# EAGLE design SMPS-DIN (EAGLE 9.6.2)
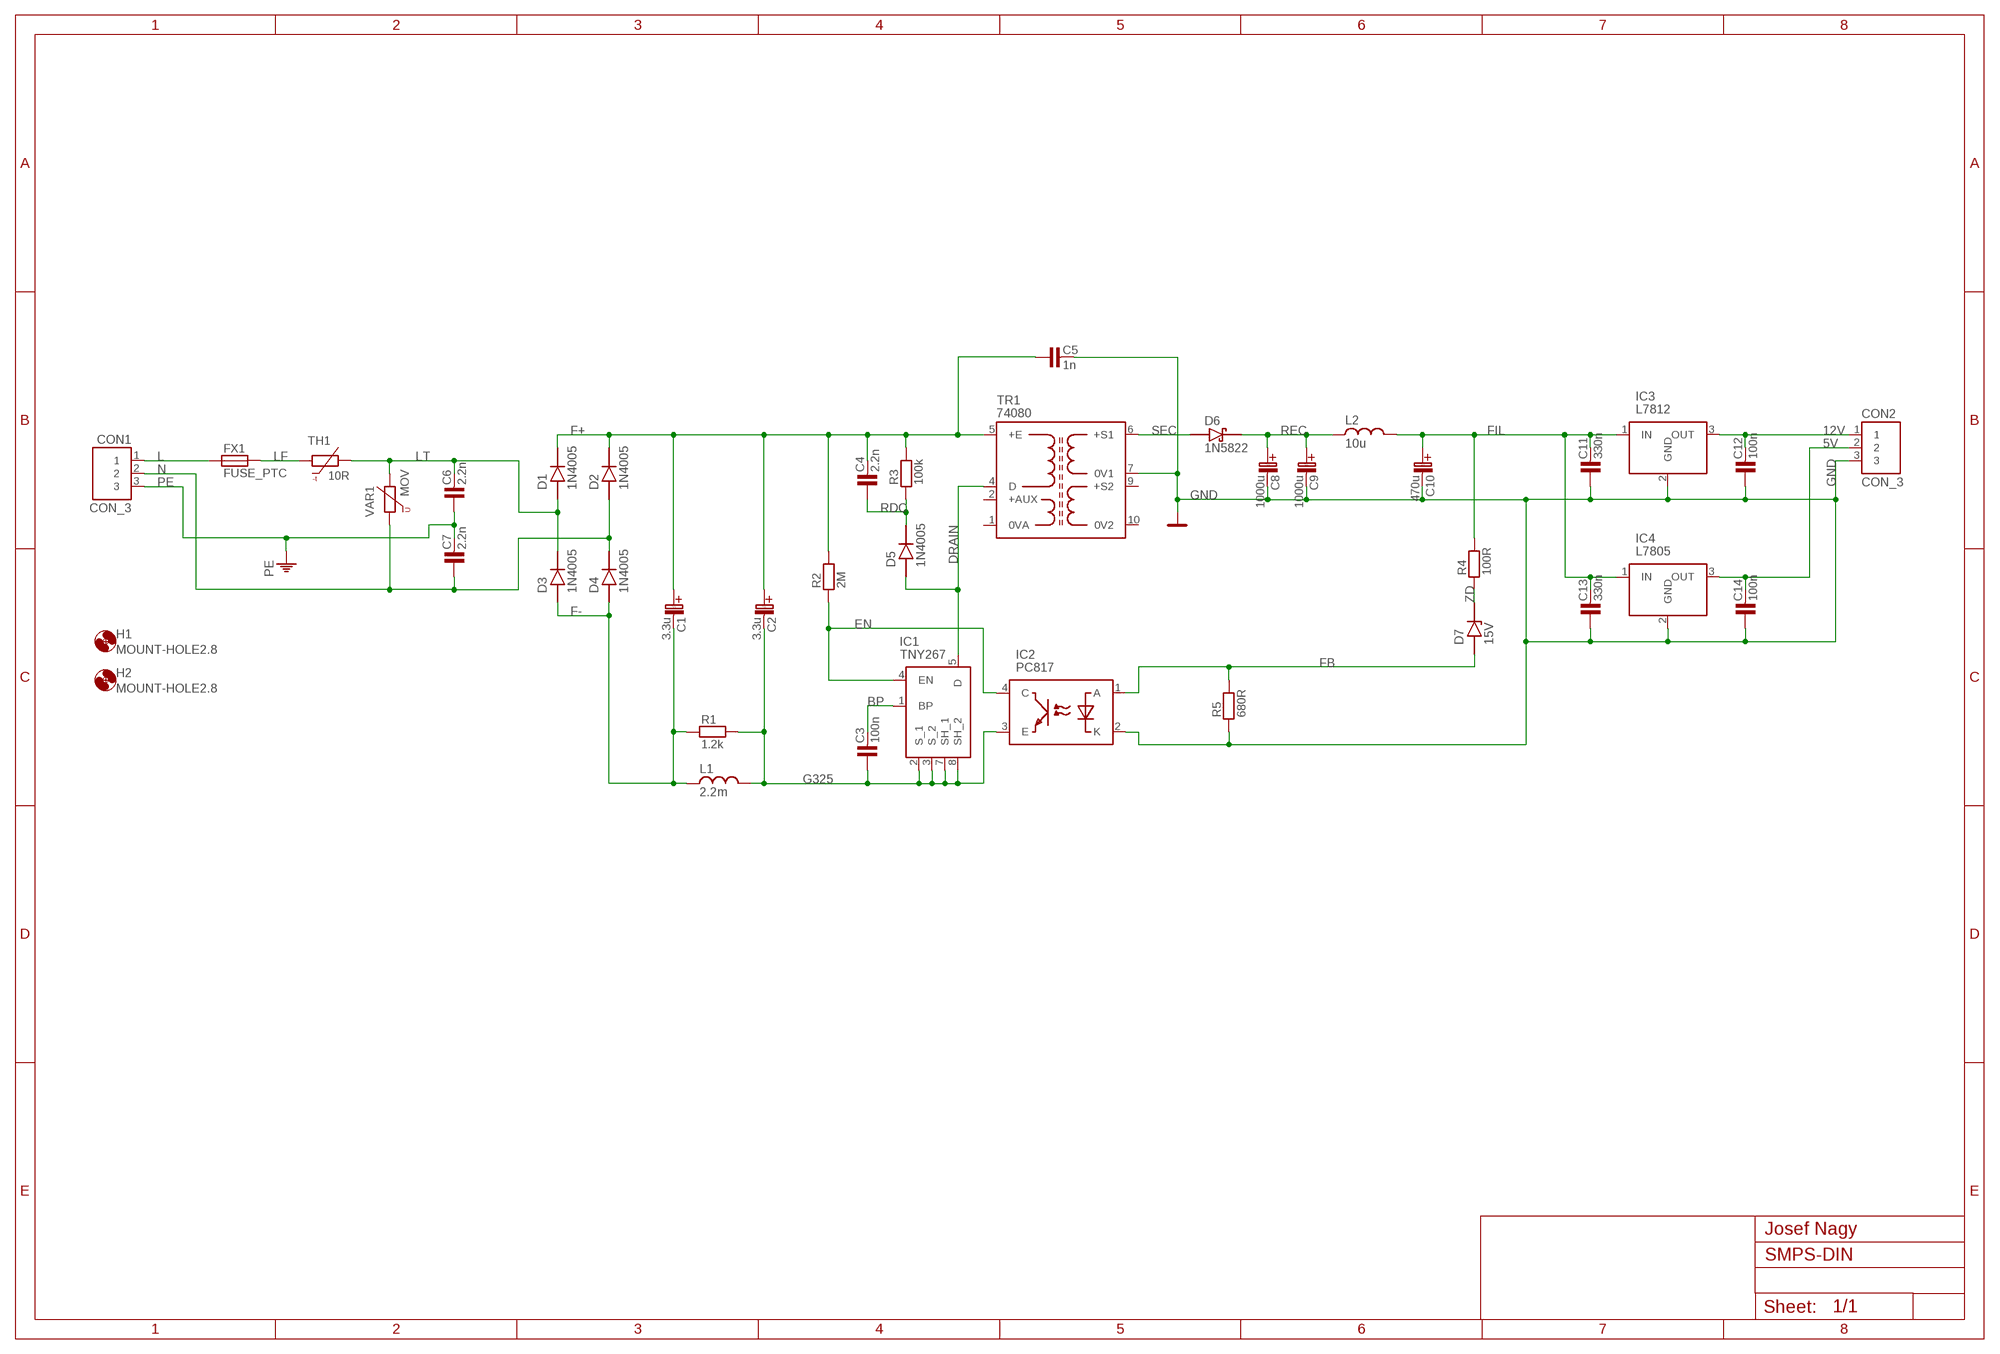
[diagram p0: schematic, sheet 1]

## Parts
C1  3.3u  C-EL_5  [C-EL_5]
C2  3.3u  C-EL_5  [C-EL_5]
C3  100n  C_KER_10  [C-10]
C4  2.2n  C_KER_10  [C-10]
C5  1n  C_KER_10  [C-10]
C6  2.2n  C_KER_10  [C-10]
C7  2.2n  C_KER_10  [C-10]
C8  1000u  C-EL_5  [C-EL_5]
C9  1000u  C-EL_5  [C-EL_5]
C10  470u  C-EL_5  [C-EL_5]
C11  330n  C_KER_5  [C-5]
C12  100n  C_KER_2,5  [C-2,5]
C13  330n  C_KER_5  [C-5]
C14  100n  C_KER_2,5  [C-2,5]
CON1  CON_3  [CON3]
CON2  CON_3  [CON3]
D1  1N4005  D_DO41V  [DO41_V]
D2  1N4005  D_DO41V  [DO41_V]
D3  1N4005  D_DO41V  [DO41_V]
D4  1N4005  D_DO41V  [DO41_V]
D5  1N4005  D_DO41V  [DO41_V]
D6  1N5822  D-SCHOTTKY_DO201V  [DO201_V]
D7  15V  D-ZENER_DO35  [DO35]
FX1  FUSE_PTC  [FUSE_PTC]
H1  MOUNT-HOLE2.8  [2,8]
H2  MOUNT-HOLE2.8  [2,8]
IC1  TNY267  TNY267PN  [P-PACKAGE(DIP-8B)_1]
IC2  PC817  PC817X4NSZ1B  [DIP762W60P254L460H455Q4N]
IC3  L7812  L78XX  [TO255P460X1020X2008-3P]
IC4  L7805  L78XX  [TO255P460X1020X2008-3P]
L1  2.2m  L_5  [L-5]
L2  10u  L_3  [L-3]
R1  1.2k  R_7,5  [R-7,5]
R2  2M  R_STOJ2  [R-STOJ2]
R3  100k  R_7,5  [R-7,5]
R4  100R  R_7,5  [R-7,5]
R5  680R  R_7,5  [R-7,5]
TH1  10R  THERMISTOR_1  [THERMISTOR]
TR1  74080  [74080]
VAR1  MOV  VARISTOR_1  [MOV_VARISTOR]

## Nets
5V: C14.2 CON2.2 IC4.3(OUT)
12V: C12.2 CON2.1 IC3.3(OUT)
BP: C3.2 IC1.1(BP)
DRAIN: D5.A IC1.5(D) TR1.4(D)
EN: IC1.4(EN) IC2.4(C) R2.1
F+: C1.C+(C_EL+) C2.C+(C_EL+) C4.2 C5.1 D1.K(C) D2.K(C) R2.2 R3.2 TR1.5(+E)
F-: C1.C-(C_EL-) D3.A D4.A L1.1 R1.1
FB: D7.A IC2.1(A) R5.2
FIL: C10.C+(C_EL+) C11.2 C13.2 IC3.1(IN) IC4.1(IN) L2.2 R4.2
G325: C2.C-(C_EL-) C3.1 IC1.2(S_1) IC1.3(S_2) IC1.7(SH_1) IC1.8(SH_2) IC2.3(E) L1.2 R1.2
GND: C5.2 C8.C-(C_EL-) C9.C-(C_EL-) C10.C-(C_EL-) C11.1 C12.1 C13.1 C14.1 CON2.3 IC2.2(K) IC3.2(GND) IC4.2(GND) R5.1 TR1.7(0V1)
L: CON1.1 FX1.1
LF: FX1.2 TH1.1
LT: C6.2 D1.A D3.K(C) TH1.2 VAR1.2
N: C7.1 CON1.2 D2.A D4.K(C) VAR1.1
PE: C6.1 C7.2 CON1.3
RDC: C4.1 D5.K(C) R3.1
REC: C8.C+(C_EL+) C9.C+(C_EL+) D6.K(C) L2.1
SEC: D6.A TR1.6(+S1)
ZD: D7.K(C) R4.1
Unconnected: TR1.1(0VA) TR1.2(+AUX) TR1.9(+S2) TR1.10(0V2)

## Notes on the sheet
- Josef Nagy

## Library data of the parts
C1 C2 C8-C10 = #_NG_knihovna:C-EL: Kondenzator - elektrolyticky
C3-C7 C11-C14 = #_NG_knihovna:C_KER: Kondenzator - keramicky
CON1 CON2 = #_NG_knihovna:CON_3
D1-D5 = #_NG_knihovna:D
D6 = #_NG_knihovna:D-SCHOTTKY; SPICEPREFIX: D
D7 = #_NG_knihovna:D-ZENER
FX1 = #_NG_knihovna:FUSE
H1 H2 = #_NG_knihovna:MOUNT-HOLE: MOUNTING HOLE with drill center marker
IC1 = #_NG_knihovna:TNY267PN: AC/DC Converters 12W 85-265 VAC 19W/230 VAC Source: Datasheet <https://componentsearchengine.com/Datasheets/1/TNY267PN.pdf>; DESCRIPTION: AC/DC Converters 12W 85-265 VAC 19W/230 VAC; HEIGHT: mm; MANUFACTURER_NAME: Power Integrations; MANUFACTURER_PART_NUMBER: TNY267PN
IC2 = #_NG_knihovna:PC817X4NSZ1B: Transistor Output Optocouplers OPTOISOLATOR 5KV TRANS DIP, Optoisolator Transistor Output 1 Channel Source: Datasheet <https://componentsearchengine.com/Datasheets/1/PC817X4NSZ1B.pdf>; DESCRIPTION: Transistor Output Optocouplers OPTOISOLATOR 5KV TRANS DIP, Optoisolator Transistor Output 1 Channel; HEIGHT: 4.55mm; MANUFACTURER_NAME: Sharp Microelectronics; MANUFACTURER_PART_NUMBER: PC817X4NSZ1B
IC3 IC4 = #_NG_knihovna:L78XX
L1 L2 = #_NG_knihovna:L
R1-R5 = #_NG_knihovna:R: Rezistor
TH1 = #_NG_knihovna:THERMISTOR
TR1 = #_NG_knihovna:74080: Transformer: impulse; 185VAC,265VAC; 915V; 915V; 1.5A; 1.5A; PCB Source: Datasheet <https://www.tme.com/Document/74b1c6fdfa5c80edd28be424718b4d1b/74080.pdf>; DESCRIPTION: Transformer: impulse; 185VAC,265VAC; 915V; 915V; 1.5A; 1.5A; PCB; HEIGHT: 18mm; MANUFACTURER_NAME: MYRRA; MANUFACTURER_PART_NUMBER: 74080
VAR1 = #_NG_knihovna:VARISTOR

## Board
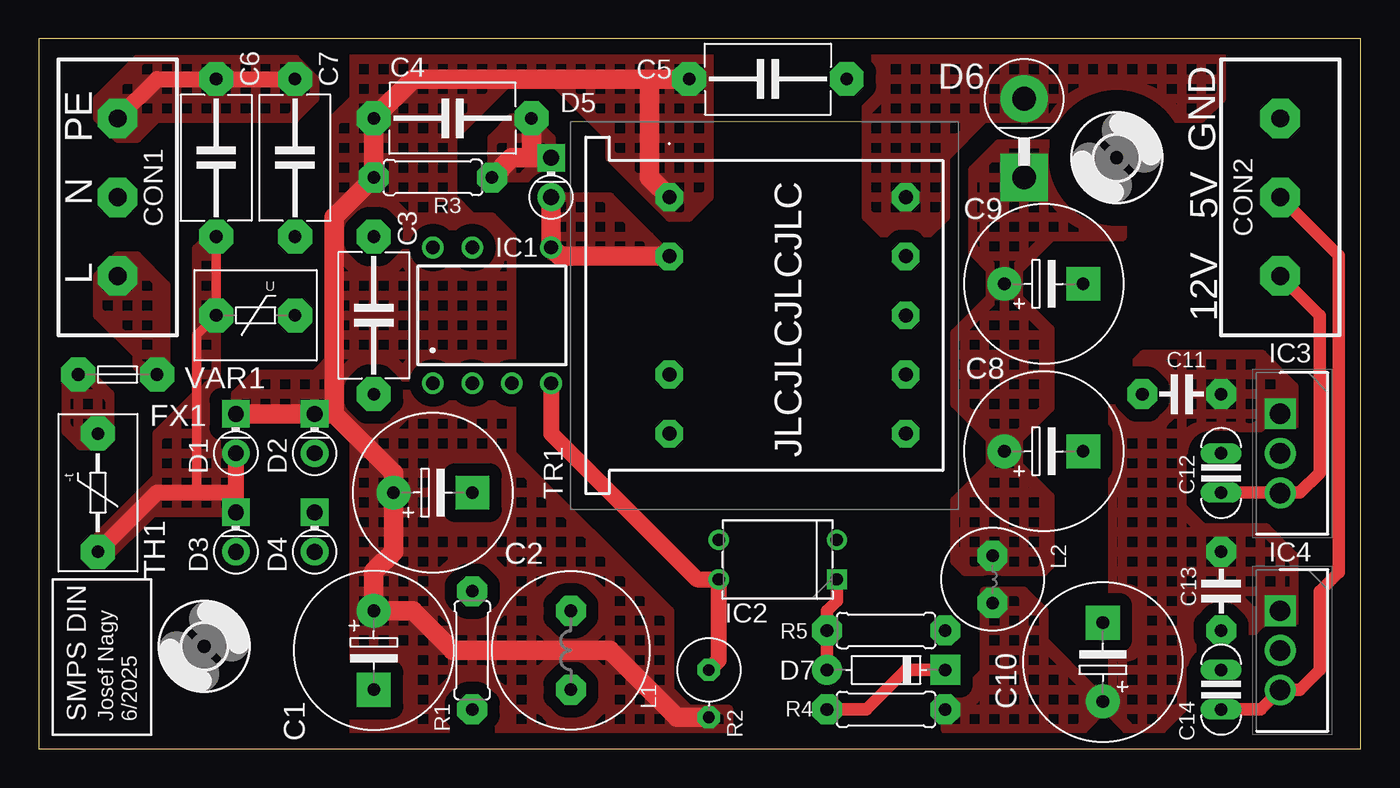
[diagram p1: board, top side]
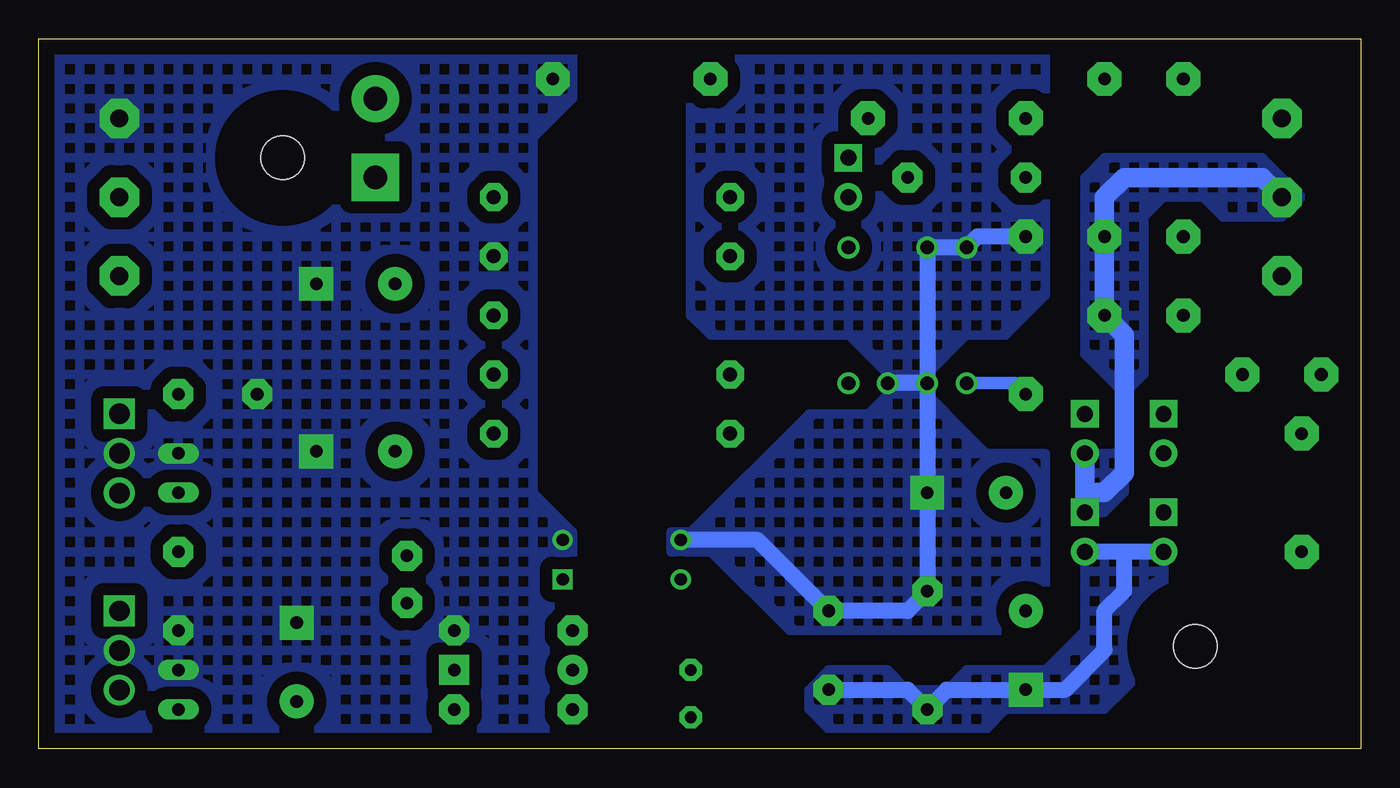
[diagram p2: board, bottom side, seen from below]

Size 85.2 x 45.77 mm. Coordinates in mm from the lower left corner, seen from the top.
Outline: 0,0 85.2,0 85.2,45.77 0,45.77 0,0
Copper layers (1*16): Top 0.035mm / dielectric 1.5mm / Bottom 0.035mm
Design rules "default": minimum track width 6mil, minimum drill 0.35mm, track to track 6mil, track to pad 6mil, pad to pad 6mil, via to via 6mil, smd to smd 6mil, copper to edge 40mil, drill to drill 6mil, minimum pad ring 10mil, minimum via ring 8mil, stop-mask expansion 4mil, vias tented up to drill 0mil, thermal gap 10mil

### Footprints (pad centres in the part's own frame; a part is rotated, then mirrored left to right if it is on the bottom)
C-EL_5 = drill 0.813 pad 2.184: C+ -2.54,0 | drill 0.813 pad 2.184 square: C- 2.54,0
C-10 = drill 0.813 pad 2.184 octagon: 1 -5.08,0; 2 5.08,0
C-5 = drill 0.813 pad 1.93 octagon: 1 -2.54,0; 2 2.54,0
C-2,5 = drill 0.813 pad 1.27 long: 1 -1.27,0; 2 1.27,0
CON3 = drill 1.143 pad 2.54 octagon: 1 -5.08,0; 2 0,0; 3 5.08,0
DO41_V = drill 1.016 pad 1.778: A -1.27,0 | drill 1.016 pad 1.778 square: K 1.27,0
DO201_V = drill 1.524 pad 3.048: A -2.54,0 | drill 1.524 pad 3.048 square: K 2.54,0
DO35 = drill 0.813 pad 1.93: A -3.81,0 | drill 0.813 pad 1.93 square: K 3.81,0
FUSE_PTC = drill 0.813 pad 2.184 octagon: 1 -2.54,0; 2 2.54,0
2,8 = hole 2.8: 0,0
P-PACKAGE(DIP-8B)_1 = drill 0.88 pad 1.4: 1 -3.81,-4.375; 2 -1.27,-4.375; 3 1.27,-4.375; 4 3.81,-4.375; 5 3.81,4.375; 7 -1.27,4.375; 8 -3.81,4.375
DIP762W60P254L460H455Q4N = drill 0.8 pad 1.27 square: 1 -3.81,1.27 | drill 0.8 pad 1.27: 2 -3.81,-1.27; 3 3.81,-1.27; 4 3.81,1.27
TO255P460X1020X2008-3P = drill 1.32 pad 1.98 square: 1 0,0 | drill 1.32 pad 1.98: 2 2.55,0; 3 5.1,0
L-5 = drill 0.813 pad 1.93 octagon: 1 -2.54,0; 2 2.54,0
L-3 = drill 0.813 pad 1.93 octagon: 1 -1.524,0; 2 1.524,0
R-7,5 = drill 0.813 pad 1.93 octagon: 1 -3.81,0; 2 3.81,0
R-STOJ2 = drill 0.75 pad 1.422 octagon: 1 -1.27,0; 2 1.778,0
THERMISTOR = drill 0.813 pad 2.184 octagon: 1 -3.81,0; 2 3.81,0
74080 = drill 0.9 pad 1.778 octagon: 1 0,-15.24; 2 0,-11.43; 4 0,-3.81; 5 0,0; 6 15.24,0; 7 15.24,-3.81; 8 15.24,-7.62; 9 15.24,-11.43; 10 15.24,-15.24
MOV_VARISTOR = drill 0.813 pad 2.184 octagon: 1 -2.54,0; 2 2.54,0

### Placement (x,y rotation side)
C1  21.59,6.35 270 top
C2  25.4,16.51 0 top
C3  21.59,27.94 270 top
C4  26.67,40.64 180 top
C5  46.99,43.18 0 top
C6  11.43,38.1 270 top
C7  16.51,38.1 90 top
C8  64.77,19.18 0 top
C9  64.77,29.97 0 top
C10  68.58,5.59 90 top
C11  73.66,22.86 0 top
C12  76.2,17.78 270 top
C13  76.2,10.16 90 top
C14  76.2,3.81 270 top
CON1  5.08,35.56 90 top
CON2  80.01,35.56 90 top
D1  12.7,20.32 90 top
D2  17.78,20.32 90 top
D3  12.7,13.97 90 top
D4  17.78,13.97 90 top
D5  33.02,36.83 90 top
D6  63.5,39.37 270 top
D7  54.61,5.08 0 top
FX1  5.08,24.13 180 top
H1  10.67,6.6 0 top
H2  69.47,38.1 0 top
IC1  29.21,27.94 0 top
IC2  47.62,12.19 180 top
IC3  80.01,21.59 270 top
IC4  80.01,8.89 270 top
L1  34.29,6.35 90 top
L2  61.47,10.92 270 top
R1  27.94,6.35 90 top
R2  43.18,3.81 270 top
R3  25.4,36.83 180 top
R4  54.61,2.54 0 top
R5  54.61,7.62 180 top
TH1  3.81,16.51 270 top
TR1  40.64,35.56 0 top
VAR1  13.97,27.94 180 top

### Tracks (layer width: path | path; a pad name or v marks a point on that pad's centre or on a via)
5V
  Top 0.813: C14.2 78.76,2.54 IC4.3 81.26,3.79 82.55,5.08 82.55,10.16 83.78,11.38 83.78,31.8 CON2.2
12V
  Top 0.813: C12.2 79.99,16.51 | 79.99,16.51 IC3.3 | CON2.1 82.55,27.94 82.55,17.78 81.28,16.51 79.99,16.51
BP
  Bottom 0.813: IC1.1 22.3,23.57 C3.2
DRAIN
  Top 1.27: D5.A IC1.5 33.59,31.75 TR1.4
  pour Top (isolate 0.813, no thermals, hatched): 33.02,35.56 33.02,31.75 40.64,31.75 39.37,33.02 36.83,35.56
EN
  Top 1.016: IC1.4 33.02,20.32 42.42,10.92 IC2.4 43.81,5.71 R2.1
F+
  Top 1.27: R2.2 41.15,2.03 36.83,6.35 26.67,6.35 24.13,8.89 C1.C+ 21.59,11.43 22.86,12.7 C2.C+ 22.86,17.78 19.05,21.59 | D1.K D2.K 19.05,21.59 | C5.1 39.37,43.18 | 39.37,43.18 24.13,43.18 C4.2 R3.2 19.05,34.29 19.05,21.59 | TR1.5 39.37,36.83 39.37,43.18
  pour Top (isolate 0.813, no thermals, hatched): 40.64,34.29 41.91,34.29 43.18,35.56 43.18,45.72 20.32,45.72 20.32,41.91 19.05,40.64 19.05,25.4 17.78,24.13 13.97,24.13 12.7,22.86 12.7,21.59 19.05,21.59 20.32,20.32 20.32,0 44.45,0 44.45,2.54 41.91,2.54 40.64,3.81 40.64,8.89 30.48,19.05 30.48,33.02 29.21,34.29 27.94,34.29 26.67,35.56 26.67,39.37 30.48,43.18 33.02,43.18 36.83,39.37 36.83,38.1
F-
  Bottom 1.016: D3.A 15.24,12.7 | 15.24,12.7 D4.A | L1.1 29.21,3.81 R1.1 26.67,3.81 C1.C- 19.05,3.81 16.51,6.35 16.51,8.89 15.24,10.16 15.24,12.7
  pour Bottom (isolate 0.813, no thermals, hatched): 12.7,12.7 17.78,12.7 17.78,8.89 17.78,7.62 20.32,5.08 22.86,5.08 25.4,5.08 26.67,3.81 29.21,3.81 30.48,5.08 34.29,5.08 35.56,3.81 35.56,2.54 34.29,1.27 33.02,1.27 27.94,1.27 24.13,1.27 22.86,2.54 17.78,2.54 16.51,2.54 15.24,3.81 12.7,6.35
FB
  Top 0.813: IC2.1 51.44,9.53 50.8,8.89 R5.2 D7.A
FIL
  pour Top (isolate 0.813, no thermals, hatched): 80.9,23.37 78.87,25.4 71.2,25.4 69.22,23.42 69.22,3.81 67.94,3.81 64.77,6.99 64.77,8.89 63.5,10.16 60.96,10.16 60.96,4.95 58.42,2.41 58.42,1.27 67.31,1.27 68.71,2.67 70.1,1.27 72.39,1.27 73.66,2.54 73.66,5.33 75.95,7.62 80.9,7.62 80.9,12.45 79.12,14.22 75.06,14.22 73.66,15.62 73.66,19.05 75.31,20.7 80.9,20.7
G325
  Bottom 1.016: C3.1 24.7,33.02 IC1.8 IC1.7 IC1.2 | IC1.2 IC1.3 | IC1.2 C2.C- R1.2 29.21,8.89 L1.2 38.86,13.46 IC2.3
  pour Bottom (isolate 0.813, no thermals, hatched): 20.32,45.72 20.32,41.91 20.32,29.21 22.86,26.67 25.4,26.67 27.94,24.13 27.94,22.86 25.4,20.32 24.13,19.05 20.32,19.05 20.32,8.89 21.59,7.62 36.83,7.62 41.91,12.7 44.45,12.7 44.45,13.97 43.18,13.97 35.56,21.59 31.75,21.59 30.48,22.86 30.48,24.13 31.75,25.4 33.02,26.67 41.91,26.67 43.18,27.94 43.18,45.72
GND
  pour Bottom (isolate 0.813, no thermals, hatched): 50.8,45.72 50.8,41.91 53.34,39.37 53.34,16.51 50.8,13.97 50.8,0 85.22,0 85.22,45.72
L
  pour Top (isolate 0.813, no thermals, hatched): 5.08,31.75 3.81,30.48 3.81,27.94 6.35,25.4 6.35,24.64 7.37,23.62 8.19,24.45 8.19,29.91 6.35,31.75
LF
  pour Top (isolate 0.813, no thermals, hatched): 2.54,24.89 1.78,24.13 1.78,20.45 2.67,19.56 4.19,19.56 4.57,19.94 4.57,22.86
LT
  Top 0.61: C6.2 VAR1.2 10.16,26.67 10.16,16.51
  Top 1.016: TH1.2 7.62,16.51 10.16,16.51 12.7,16.51 | D1.A 12.7,16.51 | 12.7,16.51 D3.K
  pour Top (isolate 0.813, no thermals, hatched): 11.43,33.53 10.16,32.26 10.16,22.86 7.62,20.32 7.62,17.53 3.05,12.95 4.06,11.94 7.37,15.24 12.7,15.24 12.7,19.05 11.43,19.05
N
  Bottom 1.27: CON1.2 6.35,36.83 15.24,36.83 16.51,35.56 C7.1 VAR1.1 15.24,26.67 15.24,17.78 16.51,16.51 17.78,16.51 | 17.78,16.51 D2.A | D4.K 17.78,16.51
  pour Bottom (isolate 0.813, no thermals, hatched): 3.81,35.56 5.08,34.29 6.35,34.29 8.89,34.29 10.16,35.56 12.7,35.56 13.97,34.29 13.97,24.13 15.24,22.86 17.78,25.4 17.78,36.83 16.51,38.1 6.35,38.1
  pour Bottom (isolate 0.813, no thermals, hatched): 17.78,19.05 15.24,19.05 15.24,16.51 16.51,15.24 17.78,15.24
PE
  Top 1.016: CON1.3 7.62,43.18 C6.1 C7.2
  pour Top (isolate 0.813, no thermals, hatched): 3.81,40.64 3.81,41.91 6.35,44.45 16.51,44.45 17.78,43.18 17.78,41.91 16.51,40.64 8.89,40.64 7.62,40.64 6.35,39.37 5.08,39.37
RDC
  Top 1.27: R3.1 30.48,38.1 31.75,38.1 | 31.75,38.1 D5.K | C4.1 31.75,38.1
  pour Top (isolate 0.813, no thermals, hatched): 31.75,40.64 33.02,39.37 33.02,38.1 31.75,36.83 29.21,36.83 29.21,39.37 30.48,40.64
REC
  pour Top (isolate 0.813, no thermals, hatched): 66.42,38.99 61.85,38.99 60.2,37.34 60.2,32 61.34,30.86 61.34,29.08 59.05,26.8 59.05,22.23 61.34,19.94 61.34,18.29 59.05,16 59.05,12.06 59.69,11.43 64.77,11.43 65.15,11.81 65.15,16.26 63.12,18.29 63.12,19.94 65.15,21.97 65.15,27.05 63.12,29.08 63.12,30.86 65.28,33.02 69.85,33.02 69.85,35.56
SEC
  pour Top (isolate 0.813, no thermals, hatched): 53.34,45.72 53.34,34.29 54.61,33.02 57.15,33.02 58.42,34.29 58.42,38.1 60.96,40.64 72.39,40.64 74.93,40.64 76.2,41.91 76.2,45.72
ZD
  Top 0.813: D7.K 55.88,5.08 53.34,2.54 R4.1

### Text on the board
tPlace: Josef Nagy / 6/2025
tNames: PE | GND | N | 5V | L | JLCJLCJLCJLC | 12V | SMPS DIN